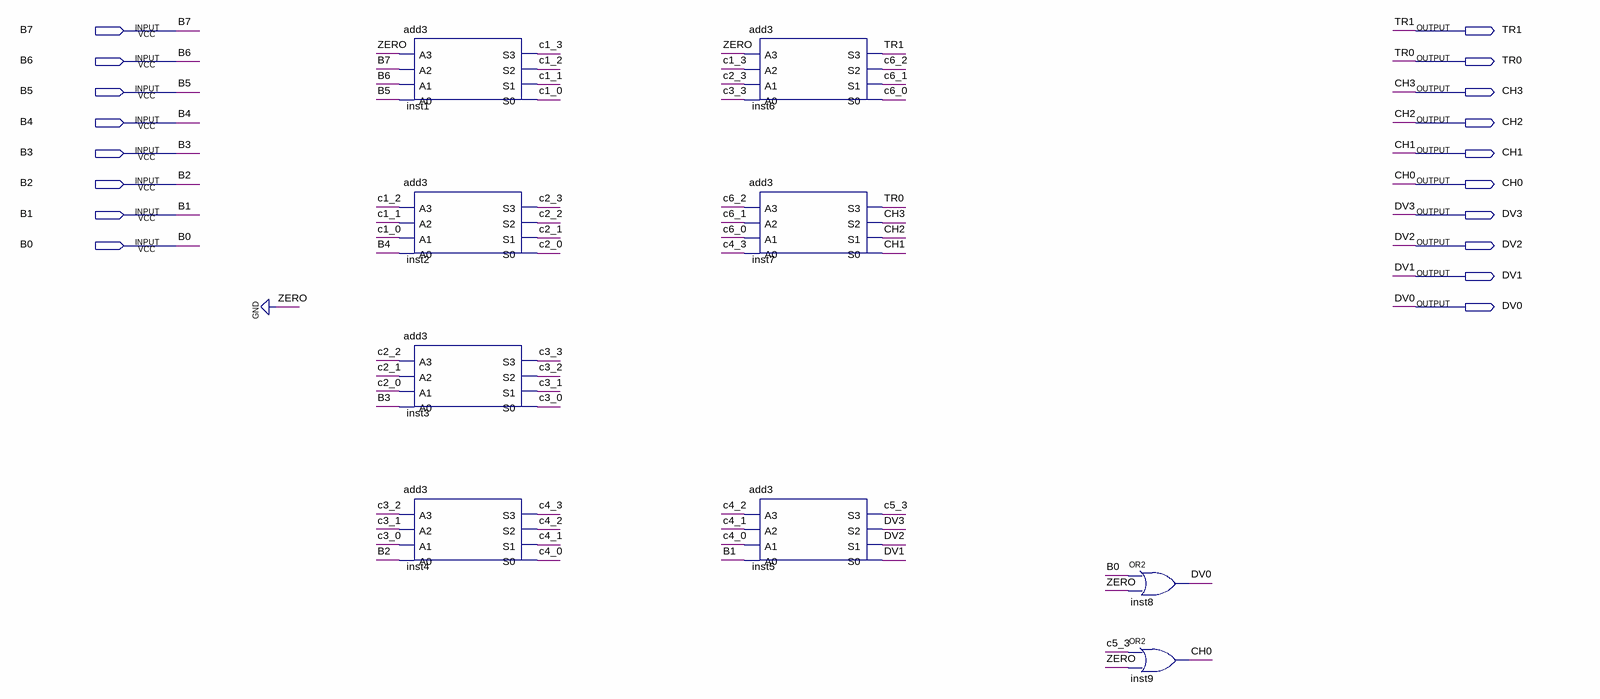
[diagram p0: schematic sheet]
// Quartus schematic bcd8.bdf as structural Verilog: 9 symbols, 18 pins
module bcd8 (
  input  B7,
  input  B6,
  input  B5,
  input  B4,
  input  B3,
  input  B2,
  input  B1,
  input  B0,
  output TR1,
  output TR0,
  output CH3,
  output CH2,
  output CH1,
  output CH0,
  output DV3,
  output DV2,
  output DV1,
  output DV0
);

  wire c1_0, c1_1, c1_2, c1_3, c2_0, c2_1, c2_2, c2_3, c3_0, c3_1, c3_2, c3_3, c4_0, c4_1, c4_2, c4_3, c5_3,
       c6_0, c6_1, c6_2;

  add3 inst1 (.A3(1'b0), .A2(B7), .A1(B6), .A0(B5), .S3(c1_3), .S2(c1_2), .S1(c1_1), .S0(c1_0));
  add3 inst2 (.A3(c1_2), .A2(c1_1), .A1(c1_0), .A0(B4), .S3(c2_3), .S2(c2_2), .S1(c2_1), .S0(c2_0));
  add3 inst3 (.A3(c2_2), .A2(c2_1), .A1(c2_0), .A0(B3), .S3(c3_3), .S2(c3_2), .S1(c3_1), .S0(c3_0));
  add3 inst4 (.A3(c3_2), .A2(c3_1), .A1(c3_0), .A0(B2), .S3(c4_3), .S2(c4_2), .S1(c4_1), .S0(c4_0));
  add3 inst6 (.A3(1'b0), .A2(c1_3), .A1(c2_3), .A0(c3_3), .S3(TR1), .S2(c6_2), .S1(c6_1), .S0(c6_0));
  add3 inst7 (.A3(c6_2), .A2(c6_1), .A1(c6_0), .A0(c4_3), .S3(TR0), .S2(CH3), .S1(CH2), .S0(CH1));
  add3 inst5 (.A3(c4_2), .A2(c4_1), .A1(c4_0), .A0(B1), .S3(c5_3), .S2(DV3), .S1(DV2), .S0(DV1));
  or inst8 (DV0, B0, 1'b0);
  or inst9 (CH0, c5_3, 1'b0);
endmodule
